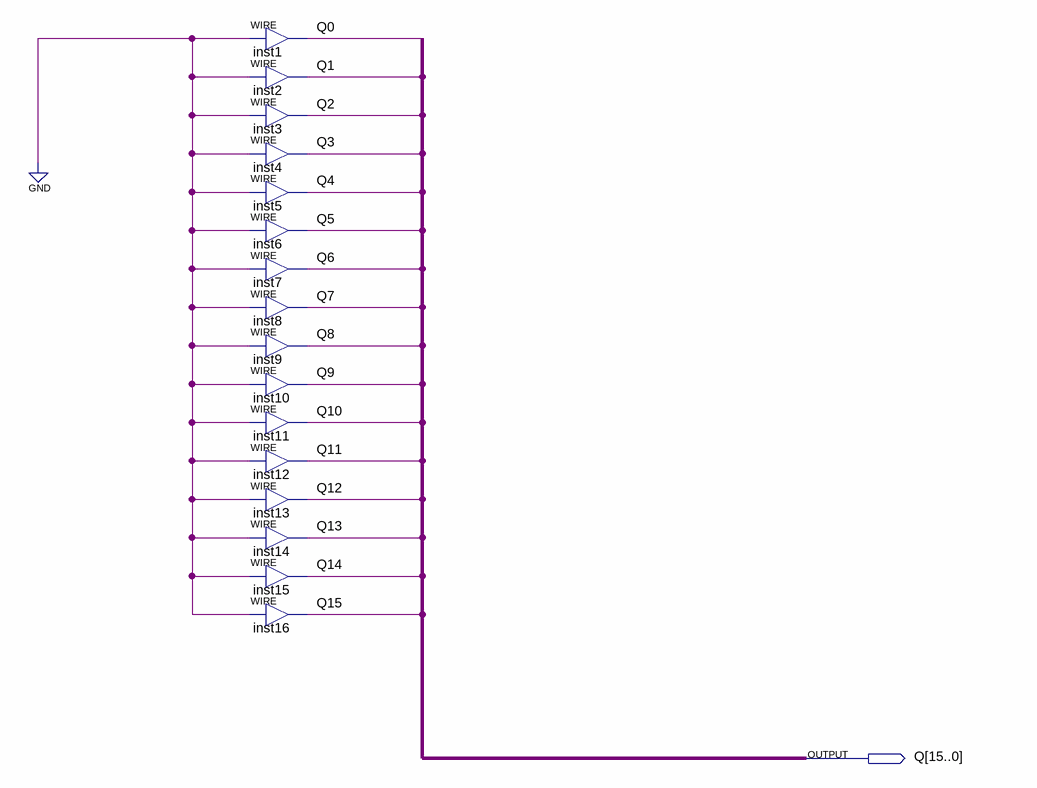
[diagram p0: schematic sheet]
// Quartus schematic GND_16b.bdf as structural Verilog: 16 symbols, 1 pins
module GND_16b (
  output [15:0] Q
);

  assign Q[0] = 1'b0;  // WIRE inst1
  assign Q[1] = 1'b0;  // WIRE inst2
  assign Q[2] = 1'b0;  // WIRE inst3
  assign Q[3] = 1'b0;  // WIRE inst4
  assign Q[4] = 1'b0;  // WIRE inst5
  assign Q[5] = 1'b0;  // WIRE inst6
  assign Q[6] = 1'b0;  // WIRE inst7
  assign Q[7] = 1'b0;  // WIRE inst8
  assign Q[8] = 1'b0;  // WIRE inst9
  assign Q[9] = 1'b0;  // WIRE inst10
  assign Q[10] = 1'b0;  // WIRE inst11
  assign Q[11] = 1'b0;  // WIRE inst12
  assign Q[12] = 1'b0;  // WIRE inst13
  assign Q[13] = 1'b0;  // WIRE inst14
  assign Q[14] = 1'b0;  // WIRE inst15
  assign Q[15] = 1'b0;  // WIRE inst16
endmodule
